# Altium schematic sheet Header_Connector.SchDoc
size A4; SheetNumber: 6; SheetTotal: 6
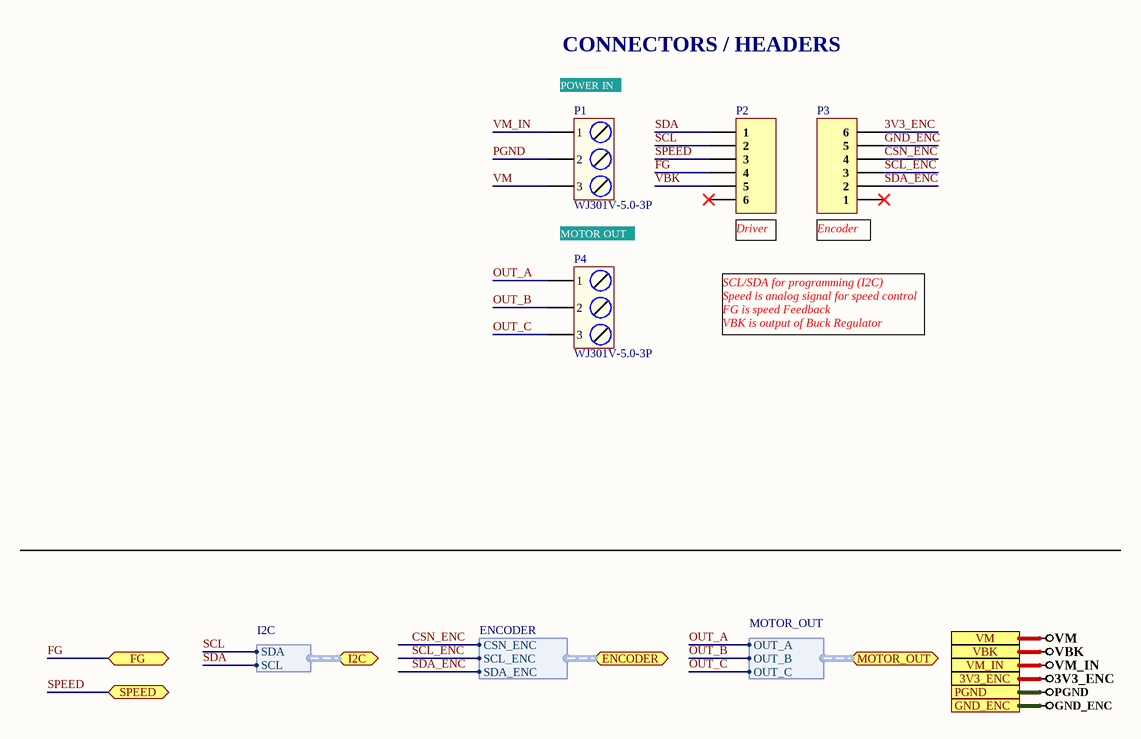
[diagram p0: Header_Connector.SchDoc]

## Parts
P1  WJ301V-5.0-3P  [WJ301V-5.0-3P]
P2  61300611121  [HDR1X6_]  (value not drawn)
P3  61300611121  [HDR1X6_]  (value not drawn)
P4  WJ301V-5.0-3P  [WJ301V-5.0-3P]

## Ports
3V3_ENC, ENCODER (bidir, harness ENCODER), FG (bidir), GND_ENC, I2C (bidir, harness I2C), MOTOR_OUT (bidir, harness MOTOR_OUT), PGND, SPEED (bidir), VBK, VM, VM_IN

## Harnesses
MOTOR_OUT: OUT_A, OUT_B, OUT_C
I2C: SDA, SCL
ENCODER: CSN_ENC, SCL_ENC, SDA_ENC

## Nets
3V3_ENC: P3.6 ; port 3V3_ENC
GND_ENC: P3.5 ; port GND_ENC
PGND: P1.2 ; port PGND
VBK: P2.5 ; port VBK
VM: P1.3 ; port VM
VM_IN: P1.1 ; port VM_IN
CSN_ENC: P3.4 ; port ENCODER.CSN_ENC
FG: P2.4 ; port FG
OUT_A: P4.1 ; port MOTOR_OUT.OUT_A
OUT_B: P4.2 ; port MOTOR_OUT.OUT_B
OUT_C: P4.3 ; port MOTOR_OUT.OUT_C
SCL: P2.2 ; port I2C.SDA
SCL_ENC: P3.3 ; port ENCODER.SCL_ENC
SDA: P2.1 ; port I2C.SCL
SDA_ENC: P3.2 ; port ENCODER.SDA_ENC
SPEED: P2.3 ; port SPEED

Not connected (* = marked no-connect by the designer): P2 6*; P3 1*

## Notes on the sheet
- CONNECTORS / HEADERS
- (near P1) POWER IN
- MOTOR OUT
- (near P2) Driver
- (near P3) Encoder
- SCL/SDA for programming (I2C)
  Speed is analog signal for speed control
  FG is speed Feedback
  VBK is output of Buck Regulator
- File:
- Title:
- Date:
- Page
- Num:
- Total:
- Drawn By: Huzaifa Ali

## Library data of the parts
P1 P4 = WJ301V-5.0-3P: P=5.0mm Screw terminal RoHS; Manufacturer: Ningbo Kangnex Elec; Value: Custom; Manufacturer Part No: WJ301V-5.0-3P; Package: Custom
P2 P3 = 61300611121: CONN HEADER 6 POS 2.54; Manufacturer: Wurth Electronics; Current Rating: 3A; Voltage Rating: 250V; Number of Positions: 6; Gender: Male; Connector Type: Male Pin; Pitch: 0.1inch; Supplier 1: Newark; Manufacturer Part Number: 61300611121; RoHS: Yes; Category: Headers and Wire Housings; Stock 1: 4996; Pricing 1: 1=0.34000, 10=0.28900, 25=0.24000, 50=0.20100, 100=0.18200 (USD); Mount: Through Hole; Contact Plating: Gold; Contact Material: Copper Alloy,Copper; Housing Material: PBT; Color: Black; Min Operating Temperature: -40°C; Max Operating Temperature: 125°C; Number of Rows: 1; Contact Gender: Male; Packaging: Bulk; Termination: Through Hole; Number of Contacts: 6; Series: WR-PHD; Contact Type: Male Pin; Contact Mating Length: 0.236inch; REACH SVHC: Unknown; Lead Free: Lead Free; RoHS Compliant: Yes; ComponentLink1URL: http://www.mouser.com/ds/2/445/6130xx11121-538006.pdf?src-supplier=Mouser; ComponentLink1Description: http://www.mouser.com/ds/2/445/6130xx11121-538006.pdf?src-supplier=Mouser; ComponentLink2URL: http://www.farnell.com/cad/1737268.pdf?src-supplier=Element14; ComponentLink2Description: http://www.farnell.com/cad/1737268.pdf?src-supplier=Element14; ComponentLink3URL: https://katalog.we-online.de/em/datasheet/6130xx11121.pdf?src-supplier=Digi-Key; ComponentLink3Description: https://katalog.we-online.de/em/datasheet/6130xx11121.pdf?src-supplier=Digi-Key; Supplier Part Number 1: 20X0957